# Altium schematic sheet MCU&LCD++.SchDoc
size Tabloid
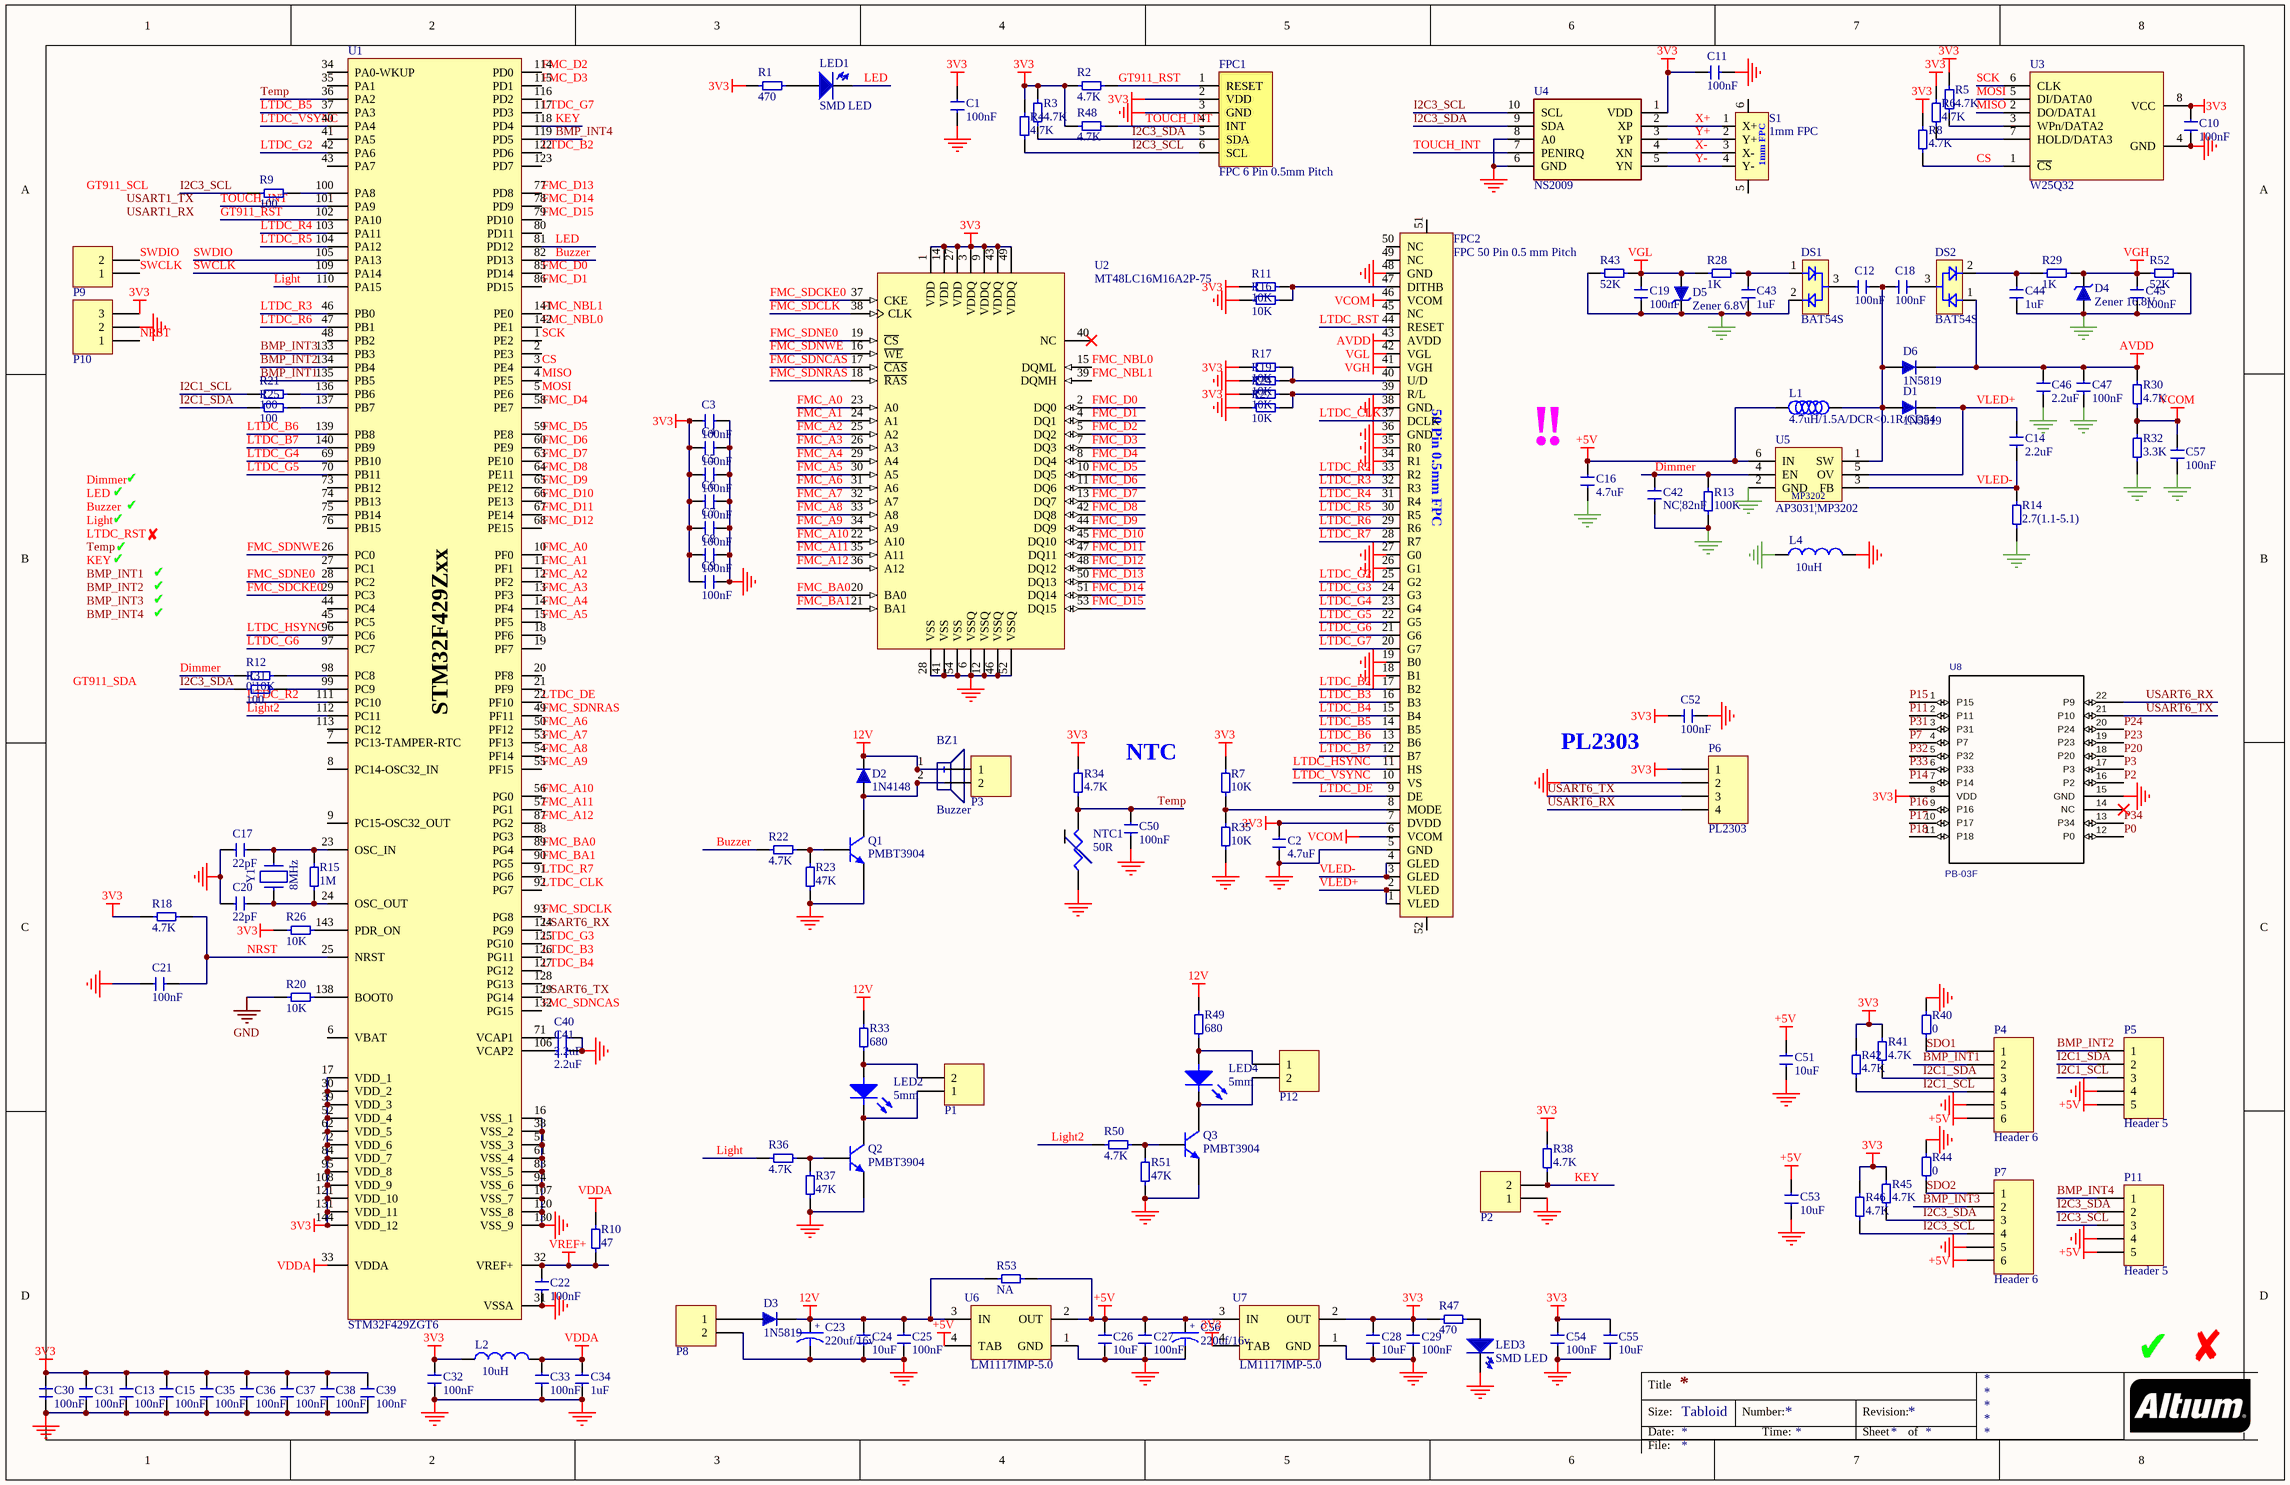
[diagram p0: MCU&LCD++.SchDoc]

## Parts
BZ1  Buzzer  [Buzzer 3M]
C1  100nF  [0603 Capacitor]
C2  4.7uF  [0603 Capacitor]
C3  100nF  [0603 Capacitor]
C4  100nF  [0603 Capacitor]
C5  100nF  [0603 Capacitor]
C6  100nF  [0603 Capacitor]
C7  100nF  [0603 Capacitor]
C8  100nF  [0603 Capacitor]
C9  100nF  [0603 Capacitor]
C10  100nF  [0603 Capacitor]
C11  100nF  [0603 Capacitor]
C12  100nF  [0603 Capacitor]
C13  100nF  [0603 Capacitor]
C14  2.2uF  [0805 Capacitor]
C15  100nF  [0603 Capacitor]
C16  4.7uF  [0603 Capacitor]
C17  22pF  [0603 Capacitor]
C18  100nF  [0603 Capacitor]
C19  100nF  [0603 Capacitor]
C20  22pF  [0603 Capacitor]
C21  100nF  [0603 Capacitor]
C22  100nF  [0603 Capacitor]
C23  220uf/16v  [$CAP-RB-80MIL-D5MM]
C24  10uF  [1206 Capacitor]
C25  100nF  [0805 Capacitor]
C26  10uF  [0805 Capacitor]
C27  100nF  [0805 Capacitor]
C28  10uF  [0603 Capacitor]
C29  100nF  [0603 Capacitor]
C30  100nF  [0603 Capacitor]
C31  100nF  [0603 Capacitor]
C32  100nF  [0603 Capacitor]
C33  100nF  [0603 Capacitor]
C34  1uF  [0603 Capacitor]
C35  100nF  [0603 Capacitor]
C36  100nF  [0603 Capacitor]
C37  100nF  [0603 Capacitor]
C38  100nF  [0603 Capacitor]
C39  100nF  [0603 Capacitor]
C40  2.2uF  [0603 Capacitor]
C41  2.2uF  [0603 Capacitor]
C42  NC|82nF  [0603 Capacitor]
C43  1uF  [0805 Capacitor]
C44  1uF  [0805 Capacitor]
C45  100nF  [0603 Capacitor]
C46  2.2uF  [0603 Capacitor]
C47  100nF  [0603 Capacitor]
C50  100nF  [0603 Capacitor]
C51  10uF  [0805 Capacitor]
C52  100nF  [0603 Capacitor]
C53  10uF  [0805 Capacitor]
C54  100nF  [0603 Capacitor]
C55  10uF  [0603 Capacitor]
C56  220uf/16v  [$CAP-RB-80MIL-D5MM]
C57  100nF  [0603 Capacitor]
D1  1N5819  [DO-214AC(SMA)]
D2  1N4148  [SOD-323]
D3  1N5819  [DO-214AC(SMA)]
D4  Zener 16.8V  [SOD-123]
D5  Zener 6.8V  [SOD-123]
D6  1N5819  [DO-214AC(SMA)]
DS1  BAT54S  [SOT-23]
DS2  BAT54S  [SOT-23]
FPC1  FPC 6 Pin 0.5mm Pitch  [FPC 6 Pin 0.5mm Pitch]
FPC2  FPC 50 Pin 0.5 mm Pitch  [FPC 50 Pin 0.5 mm Top Contact]
L1  4.7uH/1.5A/DCR<0.1R/CD54  [CD54]
L2  10uH  [0805 Resistor]
L4  10uH  [0603 Resistor]
LED1  SMD LED  [LED_0603 W]
LED2  5mm  [LED0603]
LED3  SMD LED  [LED_0603 W]
LED4  5mm  [LED0603]
NTC1  50R  [$RES-NTC-POWER 15mm]
P1  J2  [$xh-2pin male-L]  (value not drawn)
P2  J2  [$xh-2pin male-L]  (value not drawn)
P3  J2  [$xh-2pin male-L]  (value not drawn)
P4  Header 6  [$xh-6pin male-H]
P5  Header 5  [$xh-5pin male-H]
P6  PL2303  [$Header4Female]
P7  Header 6  [$xh-6pin male-H]
P8  J2  [$xh-2pin male-L]  (value not drawn)
P9  J2  [$HEADER2FEMALE]  (value not drawn)
P10  J3  [$HEADER3FEMALE]  (value not drawn)
P11  Header 5  [$xh-5pin male-H]
P12  J2  [$xh-2pin male-L]  (value not drawn)
Q1  PMBT3904  [SOT-23]
Q2  PMBT3904  [SOT-23]
Q3  PMBT3904  [SOT-23]
R1  470  [0603 Resistor]
R2  4.7K  [0603 Resistor]
R3  4.7K  [0603 Resistor]
R4  4.7K  [0603 Resistor]
R5  4.7K  [0603 Resistor]
R6  4.7K  [0603 Resistor]
R7  10K  [0603 Resistor]
R8  4.7K  [0603 Resistor]
R9  100  [0603 Resistor]
R10  47  [0603 Resistor]
R11  10K  [0603 Resistor]
R12  0|10K  [0603 Resistor]
R13  100K  [0603 Resistor]
R14  2.7(1.1-5.1)  [0805 Resistor]
R15  1M  [0805 Resistor]
R16  10K  [0603 Resistor]
R17  10K  [0603 Resistor]
R18  4.7K  [0603 Resistor]
R19  10K  [0603 Resistor]
R20  10K  [0603 Resistor]
R21  100  [0603 Resistor]
R22  4.7K  [0603 Resistor]
R23  47K  [0603 Resistor]
R24  10K  [0603 Resistor]
R25  100  [0603 Resistor]
R26  10K  [0603 Resistor]
R27  10K  [0603 Resistor]
R28  1K  [0603 Resistor]
R29  1K  [0603 Resistor]
R30  4.7K  [0603 Resistor]
R31  100  [0603 Resistor]
R32  3.3K  [0603 Resistor]
R33  680  [0805 Resistor]
R34  4.7K  [0603 Resistor]
R35  10K  [0603 Resistor]
R36  4.7K  [0603 Resistor]
R37  47K  [0603 Resistor]
R38  4.7K  [0603 Resistor]
R40  0  [0603 Resistor]
R41  4.7K  [0603 Resistor]
R42  4.7K  [0603 Resistor]
R43  52K  [0603 Resistor]
R44  0  [0603 Resistor]
R45  4.7K  [0603 Resistor]
R46  4.7K  [0603 Resistor]
R47  470  [0603 Resistor]
R48  4.7K  [0603 Resistor]
R49  680  [0603 Resistor]
R50  4.7K  [0603 Resistor]
R51  47K  [0603 Resistor]
R52  52K  [0603 Resistor]
R53  NA  [0603 Resistor]
S1  1mm FPC  [FPC 4 Pin 0.5mm]
U1  STM32F429ZGT6  [LQFP-144]
U2  MT48LC16M16A2P-75  [TSOP2-54_M]
U3  W25Q32  [SOIC-8W]
U4  NS2009  [MSOP-10]
U5  AP3031|MP3202  [SOT23-6]
U6  LM1117IMP-5.0  [SOT-223&TO-252]
U7  LM1117IMP-5.0  [SOT-223N]
U8  PB-03F  [PB-03F]
Y1  8MHz  [Xtal 2p]

## Nets
3V3: C1.2 C2.1 C3.2 C4.2 C5.2 C6.2 C7.2 C8.2 C9.2 C10.1 C11.1 C13.2 C15.2 C28.2 C29.2 C30.2 C31.2 C32.2 C35.2 C36.2 C37.2 C38.2 C39.2 C52.2 C54.2 C55.2 FPC1.2(VDD) FPC2.7(DVDD) L2.1 P6.1 P10.3 R1.1 R2.1 R3.1 R4.1 R5.1 R6.1 R7.1 R8.1 R11.1 R17.1 R18.1 R24.2 R26.1 R34.1 R38.1 R41.1 R42.1 R45.1 R46.1 R47.1 R48.1 U1.17(VDD_1) U1.30(VDD_2) U1.39(VDD_3) U1.52(VDD_4) U1.62(VDD_5) U1.72(VDD_6) U1.84(VDD_7) U1.95(VDD_8) U1.108(VDD_9) U1.121(VDD_10) U1.131(VDD_11) U1.144(VDD_12) U2.1(VDD) U2.3(VDDQ) U2.9(VDDQ) U2.14(VDD) U2.27(VDD) U2.43(VDDQ) U2.49(VDDQ) U3.8(VCC) U4.1(VDD) U7.2(OUT) U7.4(TAB) U8.8(VDD)
12V: BZ1.1 C23.1 C24.2 C25.2 D2.2(K) D3.2 P3.1 R33.2 R49.2 R53.1 U6.3(IN)
+5V: C16.2 C26.2 C27.2 C51.2 C53.2 C56.1 L1.1 P4.6 P5.5 P7.6 P11.5 R53.2 U5.6(IN) U6.2(OUT) U6.4(TAB) U7.3(IN)
AVDD: C46.1 C47.1 D6.2 DS2.1 FPC2.43(AVDD) R30.1
BGND: C16.1 C19.2 C42.1 C43.1 C44.1 C45.2 C46.2 C47.2 C57.2 D4.1(A) D5.2(K) DS1.2 L4.1 R13.2 R14.2 R32.2 R43.2 R52.1 U5.2(GND)
GND: C1.1 C2.2 C3.1 C4.1 C5.1 C6.1 C7.1 C8.1 C9.1 C10.2 C11.2 C13.1 C15.1 C17.2 C20.2 C21.2 C22.2 C23.2 C24.1 C25.1 C26.1 C27.1 C28.1 C29.1 C30.1 C31.1 C32.1 C33.1 C34.1 C35.1 C36.1 C37.1 C38.1 C39.1 C40.2 C41.2 C50.1 C51.1 C52.1 C53.1 C54.1 C55.1 C56.2 FPC1.3(GND) FPC2.5(GND) FPC2.18(B1) FPC2.19(B0) FPC2.26(G1) FPC2.27(G0) FPC2.34(R1) FPC2.35(R0) FPC2.36(GND) FPC2.38(GND) FPC2.48(GND) L4.2 LED3.2(K) NTC1.1 P2.1 P4.5 P5.4 P6.2 P7.5 P8.2 P10.2 P11.4 Q1.2(E) Q2.2(E) Q3.2(E) R16.2 R19.2 R20.1 R23.1 R27.1 R35.2 R37.1 R40.1 R44.1 R51.1 U1.16(VSS_1) U1.31(VSSA) U1.38(VSS_2) U1.51(VSS_3) U1.61(VSS_4) U1.83(VSS_5) U1.94(VSS_6) U1.107(VSS_7) U1.120(VSS_8) U1.130(VSS_9) U2.6(VSSQ) U2.12(VSSQ) U2.28(VSS) U2.41(VSS) U2.46(VSSQ) U2.52(VSSQ) U2.54(VSS) U3.4(GND) U4.6(GND) U4.8(A0) U6.1(GND) U7.1(GND) U8.15(GND)
VCOM: C57.1 FPC2.6(VCOM) FPC2.46(VCOM) R30.2 R32.1
VDDA: C33.2 C34.2 L2.2 R10.2 U1.33(VDDA)
VGH: C45.1 D4.2(K) FPC2.41(VGH) R29.2 R52.2
VGL: C19.1 D5.1(A) FPC2.42(VGL) R28.1 R43.1
VREF+: C22.1 R10.1 U1.32(VREF+)
BMP_INT1: P4.2 U1.135(PB5)
BMP_INT2: P5.1 U1.134(PB4)
BMP_INT3: P7.2 U1.133(PB3)
BMP_INT4: P11.1 U1.119(PD5)
Buzzer: R22.1 U1.82(PD13)
CS: R8.2 U1.3(PE4) U3.1(~{CS})
Dimmer: C42.2 R12.1 R13.1 U5.4(EN)
FMC_A0: U1.10(PF0) U2.23(A0)
FMC_A1: U1.11(PF1) U2.24(A1)
FMC_A2: U1.12(PF2) U2.25(A2)
FMC_A3: U1.13(PF3) U2.26(A3)
FMC_A4: U1.14(PF4) U2.29(A4)
FMC_A5: U1.15(PF5) U2.30(A5)
FMC_A6: U1.50(PF12) U2.31(A6)
FMC_A7: U1.53(PF13) U2.32(A7)
FMC_A8: U1.54(PF14) U2.33(A8)
FMC_A9: U1.55(PF15) U2.34(A9)
FMC_A10: U1.56(PG0) U2.22(A10)
FMC_A11: U1.57(PG1) U2.35(A11)
FMC_A12: U1.87(PG2) U2.36(A12)
FMC_BA0: U1.89(PG4) U2.20(BA0)
FMC_BA1: U1.90(PG5) U2.21(BA1)
FMC_D0: U1.85(PD14) U2.2(DQ0)
FMC_D1: U1.86(PD15) U2.4(DQ1)
FMC_D2: U1.114(PD0) U2.5(DQ2)
FMC_D3: U1.115(PD1) U2.7(DQ3)
FMC_D4: U1.58(PE7) U2.8(DQ4)
FMC_D5: U1.59(PE8) U2.10(DQ5)
FMC_D6: U1.60(PE9) U2.11(DQ6)
FMC_D7: U1.63(PE10) U2.13(DQ7)
FMC_D8: U1.64(PE11) U2.42(DQ8)
FMC_D9: U1.65(PE12) U2.44(DQ9)
FMC_D10: U1.66(PE13) U2.45(DQ10)
FMC_D11: U1.67(PE14) U2.47(DQ11)
FMC_D12: U1.68(PE15) U2.48(DQ12)
FMC_D13: U1.77(PD8) U2.50(DQ13)
FMC_D14: U1.78(PD9) U2.51(DQ14)
FMC_D15: U1.79(PD10) U2.53(DQ15)
FMC_NBL0: U1.142(PE1) U2.15(DQML)
FMC_NBL1: U1.141(PE0) U2.39(DQMH)
FMC_SDCKE0: U1.29(PC3) U2.37(CKE)
FMC_SDCLK: U1.93(PG8) U2.38(CLK)
FMC_SDNCAS: U1.132(PG15) U2.17(~{CAS})
FMC_SDNE0: U1.28(PC2) U2.19(~{CS})
FMC_SDNRAS: U1.49(PF11) U2.18(~{RAS})
FMC_SDNWE: U1.26(PC0) U2.16(~{WE})
GT911_RST: FPC1.1(RESET) R2.2 U1.102(PA10)
I2C1_SCL: P4.4 P5.3 R21.2 R42.2
I2C1_SDA: P4.3 P5.2 R25.2 R41.2
I2C3_SCL: FPC1.6(SCL) P7.4 P11.3 R4.2 R9.2 R46.2 U4.10(SCL)
I2C3_SDA: FPC1.5(SDA) P7.3 P11.2 R3.2 R31.1 R45.2 U4.9(SDA)
KEY: P2.2 R38.2 U1.118(PD4)
LED: LED1.2(K) U1.81(PD12)
Light: R36.1 U1.110(PA15)
Light2: R50.1 U1.112(PC11)
LTDC_B2: FPC2.17(B2) U1.122(PD6)
LTDC_B3: FPC2.16(B3) U1.126(PG11)
LTDC_B4: FPC2.15(B4) U1.127(PG12)
LTDC_B5: FPC2.14(B5) U1.37(PA3)
LTDC_B6: FPC2.13(B6) U1.139(PB8)
LTDC_B7: FPC2.12(B7) U1.140(PB9)
LTDC_CLK: FPC2.37(DCLK) U1.92(PG7)
LTDC_DE: FPC2.9(DE) U1.22(PF10)
LTDC_G2: FPC2.25(G2) U1.42(PA6)
LTDC_G3: FPC2.24(G3) U1.125(PG10)
LTDC_G4: FPC2.23(G4) U1.69(PB10)
LTDC_G5: FPC2.22(G5) U1.70(PB11)
LTDC_G6: FPC2.21(G6) U1.97(PC7)
LTDC_G7: FPC2.20(G7) U1.117(PD3)
LTDC_HSYNC: FPC2.11(HS) U1.96(PC6)
LTDC_R2: FPC2.33(R2) U1.111(PC10)
LTDC_R3: FPC2.32(R3) U1.46(PB0)
LTDC_R4: FPC2.31(R4) U1.103(PA11)
LTDC_R5: FPC2.30(R5) U1.104(PA12)
LTDC_R6: FPC2.29(R6) U1.47(PB1)
LTDC_R7: FPC2.28(R7) U1.91(PG6)
LTDC_RST: FPC2.44(RESET)
LTDC_VSYNC: FPC2.10(VS) U1.40(PA4)
MISO: U1.4(PE5) U3.2(DO/DATA1)
MOSI: U1.5(PE6) U3.5(DI/DATA0)
NRST: C21.1 P10.1 R18.2 U1.25(NRST)
P0: U8.12(P0)
P2: U8.16(P2)
P3: U8.17(P3)
P7: U8.4(P7)
P11: U8.2(P11)
P14: U8.7(P14)
P15: U8.1(P15)
P16: U8.9(P16)
P17: U8.10(P17)
P18: U8.11(P18)
P20: U8.18(P20)
P23: U8.19(P23)
P24: U8.20(P24)
P31: U8.3(P31)
P32: U8.5(P32)
P33: U8.6(P33)
P34: U8.13(P34)
SCK: U1.1(PE2) U3.6(CLK)
SDO1: P4.1 R40.2
SDO2: P7.1 R44.2
SWCLK: P9.1 U1.109(PA14)
SWDIO: P9.2 U1.105(PA13)
Temp: C50.2 NTC1.2 R34.2 U1.36(PA2)
TOUCH_INT: FPC1.4(INT) R48.2 U1.101(PA9) U4.7(PENIRQ)
USART6_RX: P6.4 U1.124(PG9) U8.22(P9)
USART6_TX: P6.3 U1.129(PG14) U8.21(P10)
VLED+: C14.2 D1.2 FPC2.1(VLED) FPC2.2(VLED) U5.5(OV)
VLED-: C14.1 FPC2.3(GLED) FPC2.4(GLED) R14.1 U5.3(FB)
X+: S1.1(X+) U4.2(XP)
X-: S1.3(X-) U4.4(XN)
Y+: S1.2(Y+) U4.3(YP)
Y-: S1.4(Y-) U4.5(YN)
NetBZ1_2: BZ1.2 D2.1(A) P3.2 Q1.3(C)
NetC12_1: C12.1 DS1.3
NetC12_2: C12.2 C18.1 D1.1 D6.1 L1.2 U5.1(SW)
NetC17_1: C17.1 R15.2 U1.23(OSC_IN) Y1.1
NetC18_2: C18.2 DS2.3
NetC20_1: C20.1 R15.1 U1.24(OSC_OUT) Y1.2
NetC40_1: C40.1 U1.71(VCAP1)
NetC41_1: C41.1 U1.106(VCAP2)
NetC43_2: C43.2 DS1.1 R28.2
NetC44_2: C44.2 DS2.2 R29.1
NetD3_1: D3.1 P8.1
NetFPC2_8: FPC2.8(MODE) R7.2 R35.1
NetFPC2_39: FPC2.39(R/L) R24.1 R27.2
NetFPC2_40: FPC2.40(U/D) R17.2 R19.1
NetFPC2_47: FPC2.47(DITHB) R11.2 R16.1
NetLED1_1: LED1.1(A) R1.2
NetLED2_1: LED2.1(A) P1.2 R33.1
NetLED2_2: LED2.2(K) P1.1 Q2.3(C)
NetLED3_1: LED3.1(A) R47.2
NetLED4_1: LED4.1(A) P12.1 R49.1
NetLED4_2: LED4.2(K) P12.2 Q3.3(C)
NetQ1_1: Q1.1(B) R22.2 R23.2
NetQ2_1: Q2.1(B) R36.2 R37.2
NetQ3_1: Q3.1(B) R50.2 R51.2
NetR5_2: R5.2 U3.3(WPn/DATA2)
NetR6_2: R6.2 U3.7(HOLD/DATA3)
NetR9_1: R9.1 U1.100(PA8)
NetR12_2: R12.2 U1.98(PC8)
NetR20_2: R20.2 U1.138(BOOT0)
NetR21_1: R21.1 U1.136(PB6)
NetR25_1: R25.1 U1.137(PB7)
NetR26_2: R26.2 U1.143(PDR_ON)
NetR31_2: R31.2 U1.99(PC9)

Not connected (* = marked no-connect by the designer): FPC2 45(NC) 49(NC) 50(NC) 51 52; S1 5 6; U1 2(PE3) 6(VBAT) 7(PC13-TAMPER-RTC) 8(PC14-OSC32_IN) 9(PC15-OSC32_OUT) 18(PF6) 19(PF7) 20(PF8) 21(PF9) 27(PC1) 34(PA0-WKUP) 35(PA1) 41(PA5) 43(PA7) 44(PC4) 45(PC5) 48(PB2) 73(PB12) 74(PB13) 75(PB14) 76(PB15) 80(PD11) 88(PG3) 113(PC12) 116(PD2) 123(PD7) 128(PG13); U2 40(NC)*; U8 14(NC)*

## Notes on the sheet
- ✔
- (near C16) !
- ✘
- NTC
- PL2303
- Labels drawn without touching a wire or pin: BMP_INT1, BMP_INT2, BMP_INT3, BMP_INT4, Buzzer, Dimmer, GT911_SCL, GT911_SDA, KEY, LED, Light, LTDC_RST, Temp, USART1_RX, USART1_TX
- Title
- Size:
- Date:
- Tabloid
- Number:
- Time:
- Revision:
- Sheet
- of
- File:
- (in symbol Cap pol$) +
- (in symbol FPC 50 Pin 0.5 mm Pitch) 50 Pin 0.5mm FPC
- (in symbol STM32F429ZGT6) STM32F429Zxx

## Library data of the parts
BZ1 = Buzzer New
C1-C22 C24-C47 C50-C55 C57 = Capacitor SMD
  C1 C3-C13 C15 C18 C19 C21 C22 C25 C27 C29-C33 C35-C39 C45 C47 C50 C52 C54 C57: Value: 100nF
  C2 C16: Value: 4.7uF
  C14 C40 C41 C46: Value: 2.2uF
  C17 C20: Value: 22pF
  C24 C26 C28 C51 C53 C55: Value: 10uF
  C34 C43 C44: Value: 1uF
  C42: Value: NC|82nF
C23 C56 = Cap pol$: Device Code: 124112
D1 D3 D6 = 1N5819(SS14)
D4 D5 = BZT52C3V3
L1 = Inductor SMT
L2 L4 = Inductor: Code_IEC: 1005; Published: 8-Jun-2000; LatestRevisionDate: 29-May-2009; LatestRevisionNote: IPC-7351 Footprint Added.; PackageReference: 0402-A; Publisher: Altium Limited; PackageDescription: Chip Inductor; Code_JEITA: 0402; Value: 10uH
LED1 LED3 = LED SMD
LED2 LED4 = LED$
NTC1 = NTC power: NTC , 50R-13mm disc type; Device Code: 143161
P1-P3 P8 P9 P12 = Connector2$: Connector, 2Pin; Device Code: 1111111
P4 P7 = Header 6: Header, 6-Pin; LatestRevisionDate: 17-Jul-2002; LatestRevisionNote: Re-released for DXP Platform.; Publisher: Altium Limited
P5 P11 = Header 5: Header, 5-Pin; LatestRevisionDate: 17-Jul-2002; LatestRevisionNote: Re-released for DXP Platform.; Publisher: Altium Limited
P6 = Header 4: Header, 4-Pin; LatestRevisionDate: 17-Jul-2002; LatestRevisionNote: Re-released for DXP Platform.; Publisher: Altium Limited
P10 = Connector3$: Connector, 3Pin; Device Code: 1111111
Q1-Q3 = PMBT2222A
R1-R38 R40-R53 = Resistor SMD
  R1 R47: Value: 470
  R2-R6 R8 R18 R22 R30 R34 R36 R38 R41 R42 R45 R46 R48 R50: Value: 4.7K
  R7 R11 R16 R17 R19 R20 R24 R26 R27 R35: Value: 10K
  R9 R21 R25 R31: Value: 100
  R10: Value: 47
  R12: Value: 0|10K
  R13: Value: 100K
  R14: Value: 2.7(1.1-5.1)
  R15: Value: 1M
  R23 R37 R51: Value: 47K
  R28 R29: Value: 1K
  R32: Value: 3.3K
  R33 R49: Value: 680
  R40 R44: Value: 0
  R43 R52: Value: 52K
  R53: Value: NA
S1 = 4 Pin 1mm FPC
U2 = MT48LC16M16A2P-75: 256Mb Synchronous High-Speed CMOS DRAM, 16Mb x 16Bit x 4 Banks, 54-Pin TSOP Pb-free, Commercial; CycleTime: 7.5ns @ CL = 3 (PC133); RowAddress: 8K (A0-A12); ColumnAddress: 512 (A0-A8); Published: 11-Oct-2004; LatestRevisionDate: 13-Apr-2006; LatestRevisionNote: IPC-7351 Footprint Added.; DatasheetVersion: RevL, Oct-2007; PackageVersion: Sep-2003; PackageReference: TSOP2-54; Publisher: Altium Limited; PackageDescription: 54-Pin Plastic Small Outline Package 0.8 mm Pitch; Code_JEDEC: MS-024-FA; ComponentLink1Description: Manufacturer Link; ComponentLink1URL: http://www.micron.com; ComponentLink2Description: Datasheet; ComponentLink2URL: http://download.micron.com/pdf/datasheets/dram/sdram/256MSDRAM.pdf
U4 = NS2009: Integrated Circuit; Manufacturer_Name: NSIWAY; Datasheet Link: https://datasheet.lcsc.com/lcsc/1810181630_Shenzhen-Nsiway-Tech-NS2009_C219024.pdf; Height: 1.12mm; Manufacturer_Part_Number: NS2009
U5 = MP3202
U6 U7 = LM1117IMP-x.x: x.x Volt, 800mA Low-Dropout Linear Regulator, 4-pin SOT-223; PartNumber: LM1117IMP-3.3; Manufacturer: National Semiconductor; PackageTopMarking: XYTT*N05B; PowerWise: N; CompType: LDO IC; Published: 4-Dec-2008; DatasheetVersion: Apr-2006; PackageVersion: revB, Apr-2003; PackageReference: MP04A; Publisher: Altium Limited; PackageDescription: Molded SOT-223, 6.50 x 3.56 x 1.6mm Body, 4 Lead, 2.3mm Pitch; Supplier 1: Farnell; Supplier Part Number 1: 7614123; RoHS: N; PinCount: 4; Code_JEDEC: TO-261-AA; Code_IPC: SOT223-4; ComponentLink1Description: LM1117 Datasheet; ComponentLink1URL: http://www.national.com/ds/LM/LM1117.pdf; ComponentLink2Description: LM1117 Web Page; ComponentLink2URL: http://www.national.com/pf/LM/LM1117.html; ComponentLink3Description: MP04A Package Page; ComponentLink3URL: http://www.national.com/packaging/folders/mp04a.html
U8 = PB-03F: Mfr_Name: Ai-Thinker; Value: RF; C: Copyright (C) 2024 Accelerated Designs. All rights reserved; Copyright: Copyright (C) 2024 Ultra Librarian. All rights reserved.; Manufacturer_Part_Number: PB-03F
Y1 = Xtal: Value: 8MHz